# Altium schematic sheet PAGE04_TEMP & HUMIDITY.SchDoc
size 386 x 246 mm
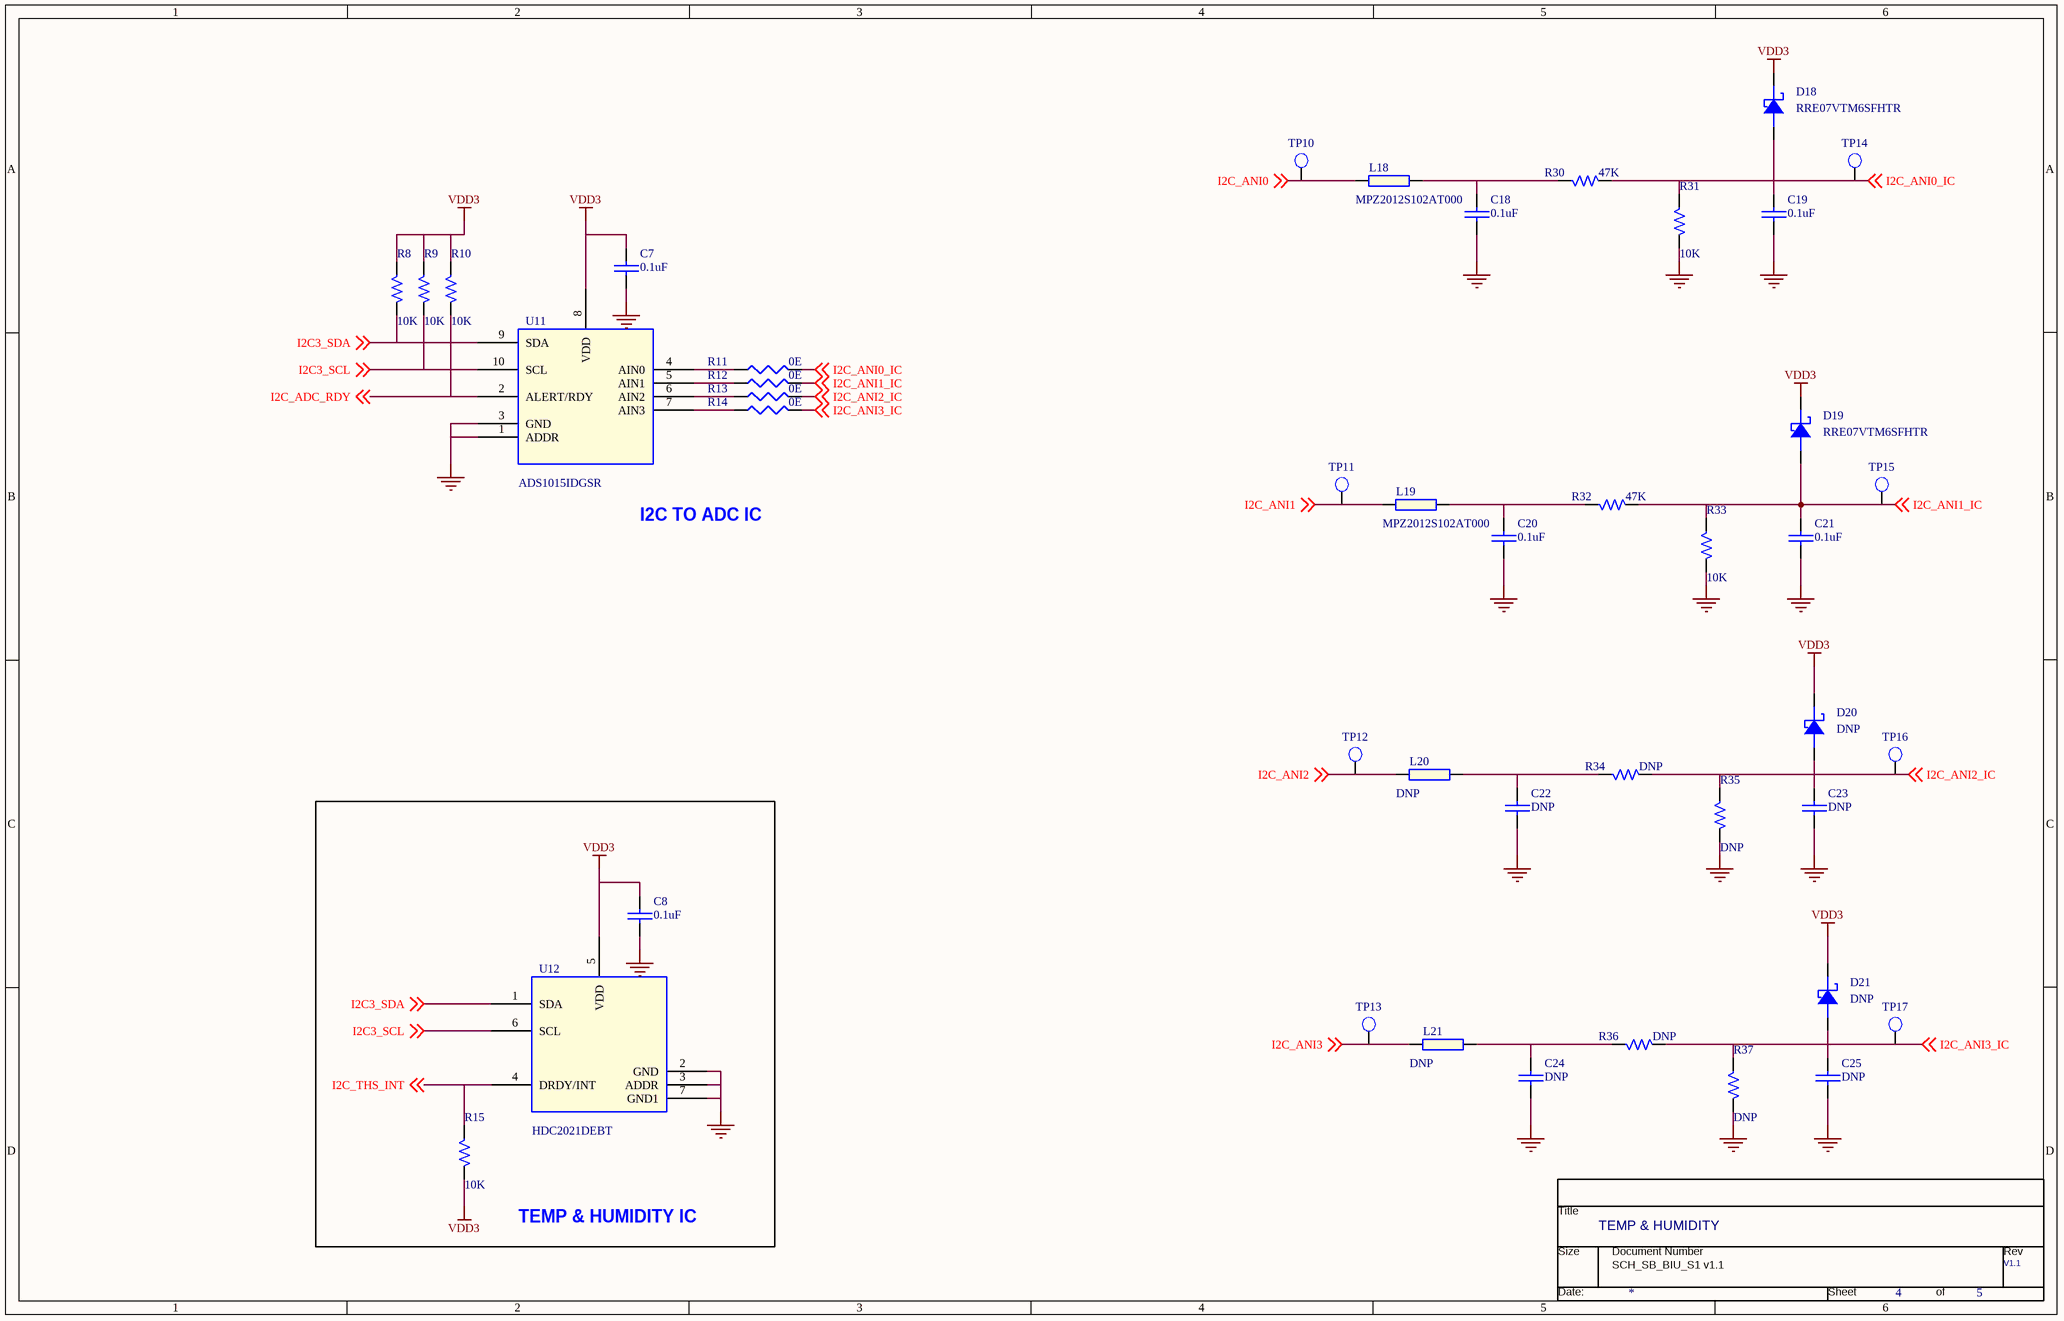
[diagram p0: PAGE04_TEMP & HUMIDITY.SchDoc]

## Parts
*  Page Count: 5  Page Number: 4  Title: TEMP & HUMIDITY  RevCode: V1.1  (hidden comment: TitleBlock0)  (graphical)
C7  0.1uF  [CAPC1005X55N_A]
C8  0.1uF  [CAPC1005X55N_A]
C18  0.1uF  [CAPC1005X55N_A]
C19  0.1uF  [CAPC1005X55N_A]
C20  0.1uF  [CAPC1005X55N_A]
C21  0.1uF  [CAPC1005X55N_A]
C22  DNP  [CAPC1005X55N_A]
C23  DNP  [CAPC1005X55N_A]
C24  DNP  [CAPC1005X55N_A]
C25  DNP  [CAPC1005X55N_A]
D18  RRE07VTM6SFHTR  [SODFL2514X80N_2K]
D19  RRE07VTM6SFHTR  [SODFL2514X80N_2K]
D20  DNP  [SODFL2514X80N_2K]
D21  DNP  [SODFL2514X80N_2K]
L18  MPZ2012S102AT000  [INDC1608X95N]
L19  MPZ2012S102AT000  [INDC1608X95N]
L20  User_Value: DNP  [INDC1608X95N]  (hidden comment: MPZ2012S102AT000)
L21  User_Value: DNP  [INDC1608X95N]  (hidden comment: MPZ2012S102AT000)
R8  10K  [AX/RC05]
R9  10K  [AX/RC05]
R10  10K  [AX/RC05]
R11  0E  [RESC1005X40N_A]
R12  0E  [RESC1005X40N_A]
R13  0E  [RESC1005X40N_A]
R14  0E  [RESC1005X40N_A]
R15  10K  [AX/RC05]
R30  47K  [AX/RC05]
R31  10K  [AX/RC05]
R32  47K  [AX/RC05]
R33  10K  [AX/RC05]
R34  DNP  [AX/RC05]
R35  DNP  [AX/RC05]
R36  DNP  [AX/RC05]
R37  DNP  [AX/RC05]
TP10  T POINT R  [TPC160H100]  (value not drawn)
TP11  T POINT R  [TPC160H100]  (value not drawn)
TP12  T POINT R  [TPC160H100]  (value not drawn)
TP13  T POINT R  [TPC160H100]  (value not drawn)
TP14  T POINT R  [TPC160H100]  (value not drawn)
TP15  T POINT R  [TPC160H100]  (value not drawn)
TP16  T POINT R  [TPC160H100]  (value not drawn)
TP17  T POINT R  [TPC160H100]  (value not drawn)
U11  ADS1015IDGSR  [VSSOP50P490X110-10N]
U12  HDC2021DEBT  [WSON100P300X300X92-7N]

## Blocks framed on the sheet
TEMP & HUMIDITY IC: C8 R15 U12

## Nets
GND: C7.2 C8.2 C18.2 C19.2 C20.2 C21.2 C22.2 C23.2 C24.2 C25.2 R31.2 R33.2 R35.2 R37.2 U11.1(ADDR) U11.3(GND) U12.2(GND) U12.3(ADDR) U12.7(GND1)
VDD3: C7.1 C8.1 D18.2(CATHODE) D19.2(CATHODE) D20.2(CATHODE) D21.2(CATHODE) R8.1 R9.1 R10.1 R15.2 U11.8(VDD) U12.5(VDD)
I2C3_SCL: R9.2 U11.10(SCL) U12.6(SCL) ; off-sheet I2C3_SCL
I2C3_SDA: R8.2 U11.9(SDA) U12.1(SDA) ; off-sheet I2C3_SDA
I2C_ADC_RDY: R10.2 U11.2(ALERT/RDY) ; off-sheet I2C_ADC_RDY
I2C_ANI0: L18.1 TP10.1(TP) ; off-sheet I2C_ANI0
I2C_ANI0_IC: C19.1 D18.1(ANODE) R11.2 R30.2 R31.1 TP14.1(TP) ; off-sheet I2C_ANI0_IC
I2C_ANI1: L19.1 TP11.1(TP) ; off-sheet I2C_ANI1
I2C_ANI1_IC: C21.1 D19.1(ANODE) R12.2 R32.2 R33.1 TP15.1(TP) ; off-sheet I2C_ANI1_IC
I2C_ANI2: L20.1 TP12.1(TP) ; off-sheet I2C_ANI2
I2C_ANI2_IC: C23.1 D20.1(ANODE) R13.2 R34.2 R35.1 TP16.1(TP) ; off-sheet I2C_ANI2_IC
I2C_ANI3: L21.1 TP13.1(TP) ; off-sheet I2C_ANI3
I2C_ANI3_IC: C25.1 D21.1(ANODE) R14.2 R36.2 R37.1 TP17.1(TP) ; off-sheet I2C_ANI3_IC
I2C_THS_INT: R15.1 U12.4(DRDY/INT) ; off-sheet I2C_THS_INT
NetC18_1: C18.1 L18.2 R30.1
NetC20_1: C20.1 L19.2 R32.1
NetC22_1: C22.1 L20.2 R34.1
NetC24_1: C24.1 L21.2 R36.1
NetR11_1: R11.1 U11.4(AIN0)
NetR12_1: R12.1 U11.5(AIN1)
NetR13_1: R13.1 U11.6(AIN2)
NetR14_1: R14.1 U11.7(AIN3)

## Notes on the sheet
- I2C TO ADC IC
- SCH_SB_BIU_S1 v1.1
- (in symbol TitleBlock0) Title; Size; Document Number; Rev; Date:; Sheet; of

## Library data of the parts
* = TitleBlock0: Page Size: A; Page Create Date: March  8, 1995; Page Modify Date: *
C7 C8 C18-C21 = CAP_NP_78: CAP CER 0.1uF 16V 10% X7R 0402; Manufacturer: MURATA; Manufacturere's P/N: GRM155R71C104KA88J; CLASS: DISCRETE; SIGNAL_MODEL: DEFAULT_CAPACITOR_100000pF_2_1; AGILE_PN: 150-75182; CAD_APPROVED: Yes; FPLIST: CC0402_25,CC0402_HD,0402_CC; WVDC: 16V; Tolerance: 10%; ROHS: Yes; HEIGHT: 0.635MM; TOL: 10%; Package: 0402; PCB Footprint: CAPC1005X55N_A
C22-C25 = CAP_NP_78: CAP CER 0.1uF 16V 10% X7R 0402; Manufacturere's P/N: GRM155R71C104KA88J; Manufacturer: MURATA; CLASS: DISCRETE; FPLIST: CC0402_25,CC0402_HD,0402_CC; CAD_APPROVED: Yes; AGILE_PN: 150-75182; SIGNAL_MODEL: DEFAULT_CAPACITOR_100000pF_2_1; Package: 0402; TOL: 10%; HEIGHT: 0.635MM; ROHS: Yes; Tolerance: 10%; WVDC: 16V; PCB Footprint: CAPC1005X55N_A
D18 D19 = DIODE SCHOTTKY: RECTIFIER DIODES (CORRESPONDS TO; Manufacturer: Rohm Semiconductor; Manufacturere's P/N: RRE07VTM6SFHTR; Manufacturer Part Number: RRE07VTM6SFHTR; Package: 2-SMD, Flat Lead; PCB Footprint: SODFL2514X80N_2K
D20 D21 = DIODE SCHOTTKY: RECTIFIER DIODES (CORRESPONDS TO; Manufacturere's P/N: RRE07VTM6SFHTR; Manufacturer: Rohm Semiconductor; Manufacturer Part Number: RRE07VTM6SFHTR; Package: 2-SMD, Flat Lead; PCB Footprint: SODFL2514X80N_2K
L18-L21 = L-33R100MHz-3A-25%-0603: FERRITE BEAD 1 KOHM 0805 1LN; Manufacturer: TDK Corporation; Tolerance: 25%; Rating: 3A; PCB Footprint: FB_MPZ2012S300ATD25; Package: 0805; Manufacturer Part Number: MPZ2012S102AT000; Manufacturere's P/N: MPZ2012S102AT000
  L18 L19: User_Value: MPZ2012S102AT000
R8 R31 R33 = R_0: RES SMD 10K OHM 1% 1/10W 0603; TC2: 0; POWER: RMAX; MAX_TEMP: RTMAX; SLOPE: RSMAX; VOLTAGE: RVMAX; PSpiceTemplate: R^@REFDES %1 %2 ?TOLERANCE|R^@REFDES| @VALUE TC=@TC1,@TC2 ?TOLERANCE|\n.model R^@REFDES RES R=1 DEV=@TOLERANCE%|; DIST: FLAT; MFG_PN01: RCA060310K0FKEA; MFG_NAME01: Vishay Dale; PCB Footprint: RESC1608X55N_B; TC1: 0; TOLERANCE: 1%; Manufacturer: Vishay Dale; Manufacturere's P/N: RCA060310K0FKEA; Package: 0603; Manufacturer Part Number: RCA060310K0FKEA; Value: 10K
R9 R10 = R_0: RES SMD 10K OHM 1% 1/10W 0603; Manufacturere's P/N: RCA060310K0FKEA; Manufacturer: Vishay Dale; TC2: 0; POWER: RMAX; MAX_TEMP: RTMAX; SLOPE: RSMAX; VOLTAGE: RVMAX; PSpiceTemplate: R^@REFDES %1 %2 ?TOLERANCE|R^@REFDES| @VALUE TC=@TC1,@TC2 ?TOLERANCE|\n.model R^@REFDES RES R=1 DEV=@TOLERANCE%|; DIST: FLAT; PCB Footprint: RESC1608X55N_B; TC1: 0; TOLERANCE: 1%; Package: 0603; MFG_NAME01: Vishay Dale; MFG_PN01: RCA060310K0FKEA; Manufacturer Part Number: RCA060310K0FKEA; Value: 10K
R11-R14 = RES_57: RES 0.0 OHM 1/16W 0402 SMD; Manufacturere's P/N: CRCW04020000Z0ED; Manufacturer: VISHAY; CLASS: DISCRETE; SIGNAL_MODEL: DEFAULT_RESISTOR_0.001OHM_2_1; AGILE_PN: 470-79965; FPLIST: RC0402_25,RC0402_HD,RC0402_X2,0402_CC; ROHS: Yes; Package: 0402; PCB Footprint: RESC1005X40N_A
R15 = R_0: RES SMD 10K OHM 1% 1/10W 0603; Manufacturer: Vishay Dale; Manufacturere's P/N: RCA060310K0FKEA; TC2: 0; POWER: RMAX; MAX_TEMP: RTMAX; SLOPE: RSMAX; VOLTAGE: RVMAX; PSpiceTemplate: R^@REFDES %1 %2 ?TOLERANCE|R^@REFDES| @VALUE TC=@TC1,@TC2 ?TOLERANCE|\n.model R^@REFDES RES R=1 DEV=@TOLERANCE%|; DIST: FLAT; PCB Footprint: RESC1608X55N_B; TC1: 0; TOLERANCE: 1%; Package: 0603; Manufacturer Part Number: RCA060310K0FKEA; Value: 10K
R30 R32 = R_0: RES SMD 47K OHM 5% 1/10W 0603; Manufacturer Part Number: AC0603JR-0747KL; Manufacturer: Yageo; TC2: 0; POWER: RMAX; MAX_TEMP: RTMAX; SLOPE: RSMAX; VOLTAGE: RVMAX; TOLERANCE: 1%; PSpiceTemplate: R^@REFDES %1 %2 ?TOLERANCE|R^@REFDES| @VALUE TC=@TC1,@TC2 ?TOLERANCE|\n.model R^@REFDES RES R=1 DEV=@TOLERANCE%|; DIST: FLAT; PCB Footprint: RESC1608X55N_A; MFG_NAME01: Vishay Dale; TC1: 0; MFG_PN01: AC0603JR-0747KL; Manufacturere's P/N: AC0603JR-0747KL; Package: 0603; Value: 47K
R34 R36 = R_0: RES SMD 47K OHM 5% 1/10W 0603; Manufacturere's P/N: AC0603JR-0747KL; Manufacturer: Yageo; TC2: 0; POWER: RMAX; MAX_TEMP: RTMAX; SLOPE: RSMAX; VOLTAGE: RVMAX; TOLERANCE: 1%; PSpiceTemplate: R^@REFDES %1 %2 ?TOLERANCE|R^@REFDES| @VALUE TC=@TC1,@TC2 ?TOLERANCE|\n.model R^@REFDES RES R=1 DEV=@TOLERANCE%|; DIST: FLAT; PCB Footprint: RESC1608X55N_A; MFG_NAME01: Vishay Dale; TC1: 0; Package: 0603; MFG_PN01: AC0603JR-0747KL; Manufacturer Part Number: AC0603JR-0747KL; Value: DNP
R35 R37 = R_0: RES SMD 10K OHM 1% 1/10W 0603; Manufacturer Part Number: RCA060310K0FKEA; Manufacturer: Vishay Dale; TC2: 0; POWER: RMAX; MAX_TEMP: RTMAX; SLOPE: RSMAX; VOLTAGE: RVMAX; PSpiceTemplate: R^@REFDES %1 %2 ?TOLERANCE|R^@REFDES| @VALUE TC=@TC1,@TC2 ?TOLERANCE|\n.model R^@REFDES RES R=1 DEV=@TOLERANCE%|; DIST: FLAT; PCB Footprint: RESC1608X55N_B; TC1: 0; TOLERANCE: 1%; Package: 0603; Manufacturere's P/N: RCA060310K0FKEA; MFG_NAME01: Vishay Dale; MFG_PN01: RCA060310K0FKEA; Value: DNP
U11 = ADS1015IDGSR_1: Analog to Digital Converters - ADC 12B ADC with Int MUX; Manufacturer: TI; Package: MSOP-10; Manufacturere's P/N: ADS1015IDGSR; PCB Footprint: VSSOP50P490X110-10N
U12 = HDC2021DEBT_2: Board Mount Humidity Sensors Low-power humidity and temperature digital sensor; Manufacturer: TI; PCB Footprint: WSON100P300X300X92-7N; Manufacturere's P/N: HDC2021DEBT; Package: 6-WSON
TP10-TP17 = T POINT R: PCB Footprint: TPC160H100